# Altium schematic sheet MICRO_SD_CARD_INTERFACE.SchDoc
size A4; SheetNumber: 8; SheetTotal: 20
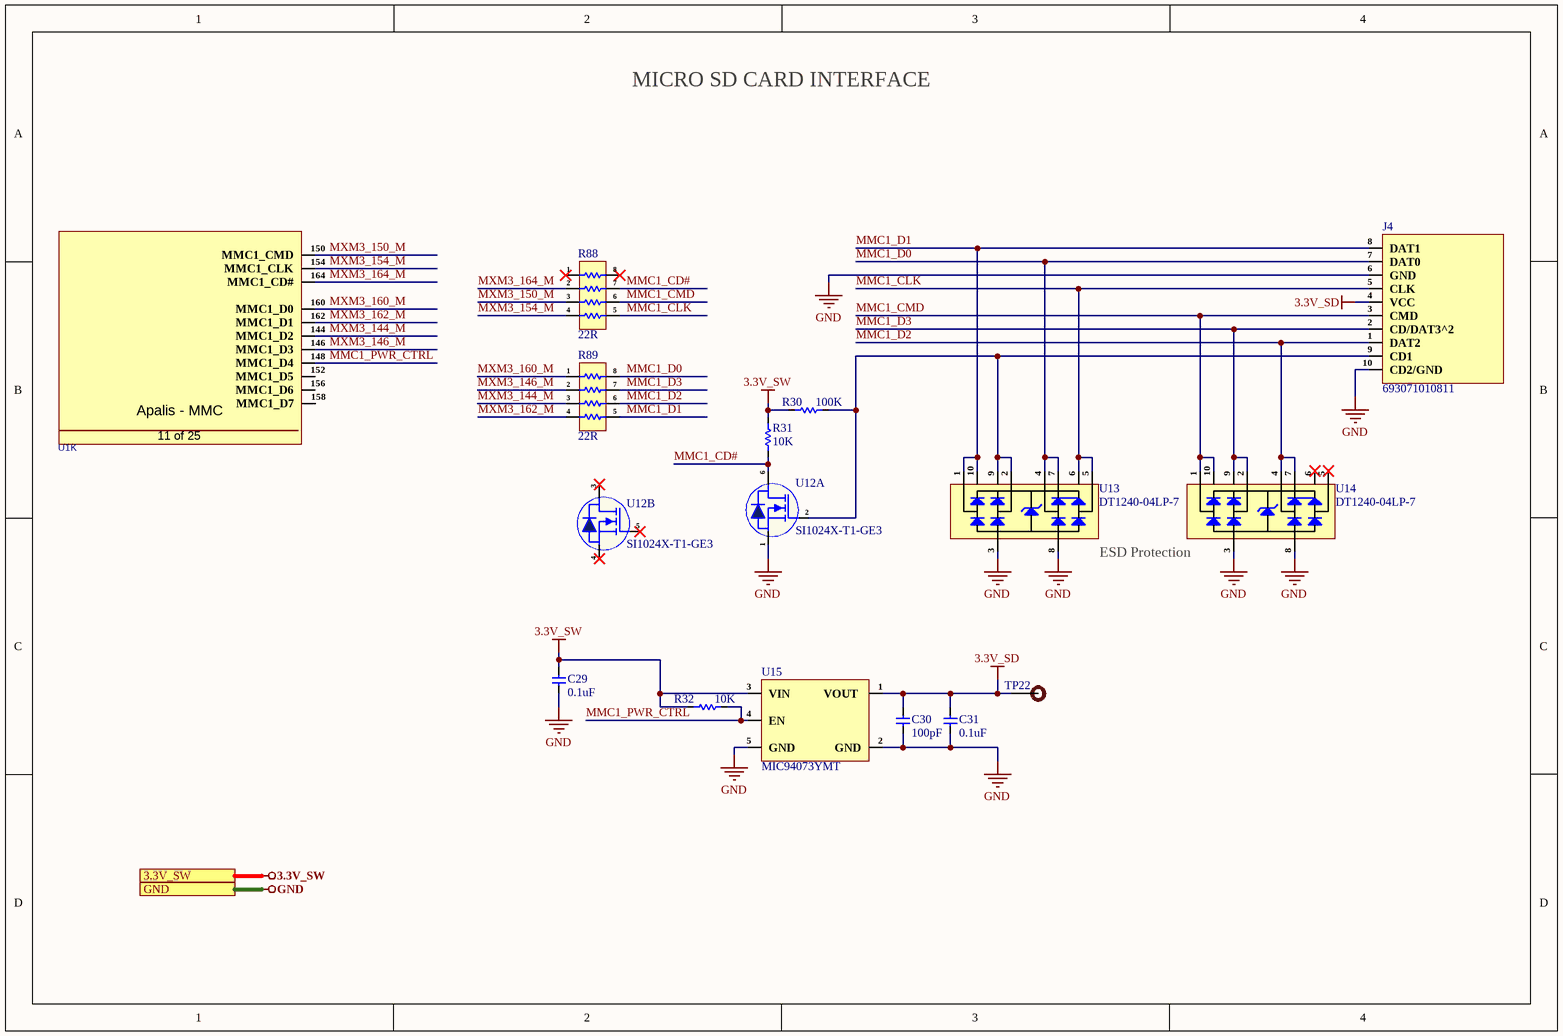
[diagram p0: MICRO_SD_CARD_INTERFACE.SchDoc]

## Parts
C29  0.1uF  [Cap-0402]
C30  100pF  [Cap-0603]
C31  0.1uF  [Cap-0402]
J4  693071010811  [693071010811]
R30  100K  [Res-0603]
R31  10K  [Res-0603]
R32  10K  [Res-0603]
R88  22R  [YC164-JR-0722RL]
R89  22R  [YC164-JR-0722RL]
TP22  DNP  [Test-point]  (value not drawn)
U1  MM70-314B1-2-R300  [MM70-314B1-2-R300]  (value not drawn)  (part K of 25)
U12  SI1024X-T1-GE3  [SC-89]  (parts A,B of 2)
U13  DT1240-04LP-7  [U-DFN2510-10]
U14  DT1240-04LP-7  [U-DFN2510-10]
U15  MIC94073YMT  [4-TMLF® (1.2x1.6)]

## Ports
3.3V_SW (see Top_Sheet[1D], DIGITAL_I-O_O-P[1D], ETHERNET_INTERFACE[1D], FUTURE_USE_CONNECTOR[1D], HDMI_INTERFACE[1D], I2C_INTERFACE[1B], UART_INTERFACE[1D]), GND (see Top_Sheet[1D], 03-CAN2_SPI_CAN_CONTROLLER[1D], APALIS_POWER_SUPPLY[1D], CAN2_SPI_CAN_CONTROLLER[1D], CODEC_INTERFACE[1D], CONNECTORS[1D], DC_DC_CONVERTER[1D], DIGITAL_I-O_O-P[1D], ETHERNET_INTERFACE[1D], FUTURE_USE_CONNECTOR[1D], GPIO_NC_INTERFACE[4B], HDMI_INTERFACE[1D], I2C_INTERFACE[1B], INPUT_SUPPLY_PROTECTION[1D], LTE_MODULE[1D], MECHANICAL_FOR_PCB[1D], Reset_and_SDIO[1D], UART_INTERFACE[1D], USB3.0_INTERFACE[1D])

## Nets
3.3V_SD: C30.2 C31.2 J4.4(VCC) TP22.1 U15.1(VOUT)
3.3V_SW: C29.2 R30.1 R31.2 R32.2 U15.3(VIN) ; port 3.3V_SW
GND: C29.1 C30.1 C31.1 J4.6(GND) J4.10(CD2/GND) U12.1(S1) U13.3 U13.8 U14.3 U14.8 U15.2(GND) U15.5(GND) ; port GND
MMC1_CD#: R31.1 R88.7 U12.6(D1)
MMC1_CLK: J4.5(CLK) R88.5 U13.5 U13.6
MMC1_CMD: J4.3(CMD) R88.6 U14.1 U14.10
MMC1_D0: J4.7(DAT0) R89.8 U13.4 U13.7
MMC1_D1: J4.8(DAT1) R89.5 U13.1 U13.10
MMC1_D2: J4.1(DAT2) R89.6 U14.4 U14.7
MMC1_D3: J4.2(CD/DAT3^2) R89.7 U14.2 U14.9
MMC1_PWR_CTRL: R32.1 U1.148(MMC1_D4) U15.4(EN)
MXM3_144_M: R89.3 U1.144(MMC1_D2)
MXM3_146_M: R89.2 U1.146(MMC1_D3)
MXM3_150_M: R88.3 U1.150(MMC1_CMD)
MXM3_154_M: R88.4 U1.154(MMC1_CLK)
MXM3_160_M: R89.1 U1.160(MMC1_D0)
MXM3_162_M: R89.4 U1.162(MMC1_D1)
MXM3_164_M: R88.2 U1.164(MMC1_CD#)
NetJ4_9: J4.9(CD1) R30.2 U12.2(G1) U13.2 U13.9

Not connected (* = marked no-connect by the designer): R88 1* 8*; U1 152(MMC1_D5) 156(MMC1_D6) 158(MMC1_D7); U12 3(D2)* 4(S2)* 5(G2)*; U14 5* 6*

## Notes on the sheet
- MICRO SD CARD INTERFACE
- ESD Protection
- (in symbol MM70-314B1-2-R300, part K) Apalis - MMC; 11 of 25

## Library data of the parts
C29 C31 = C0402C104K4REC7867: Cap Cer 0402 0.1UF 16V X7R 10%; Manufacturer: KEMET; Item Type: Capacitor; Supplier: Digi-Key; Supplier Part Number: 399-C0402C104K4REC7867CT-ND; Manufacturer Part Number: C0402C104K4REC7867; RoHS: No; Category: Ceramic Capacitors; Stock: 10918; Pricing: 1=0.1, 10=0.072, 50=0.0408, 100=0.0338, 500=0.02372, 1000=0.01963, 2500=0.01827, 5000=0.01672 (USD)
C30 = C1608NP01H101J080AA: CAP CER 100PF 50V NP0 0603; Manufacturer: TDK; Item Type: Capacitor; Supplier: Arrow Electronics; Supplier Part Number: C1608NP01H101J080AA; Manufacturer Part Number: C1608NP01H101J080AA; RoHS: Yes; Category: Ceramic Capacitors; Stock: 1236; Pricing: 1=0.1172, 10=0.0734, 25=0.0727, 50=0.0628, 100=0.0474, 250=0.0469, 500=0.0388, 1000=0.0313 (USD); ComponentLink1URL: http://www.mouser.com/ds/2/400/tdk_mlcc_commercial_general_en-542463.pdf?src-supplier=Mouser; ComponentLink1Description: http://www.mouser.com/ds/2/400/tdk_mlcc_commercial_general_en-542463.pdf?src-supplier=Mouser; ComponentLink2URL: https://datasheet.octopart.com/C1608NP01H101J080AA-TDK-datasheet-43914282.pdf?src-supplier=Future+Electronics; ComponentLink2Description: https://datasheet.octopart.com/C1608NP01H101J080AA-TDK-datasheet-43914282.pdf?src-supplier=Future+Electronics; ComponentLink3URL: https://product.tdk.com/info/en/catalog/datasheets/mlcc_commercial_hightemp_en.pdf?ref_disty=digikey&src-supplier=Digi-Key; ComponentLink3Description: https://product.tdk.com/info/en/catalog/datasheets/mlcc_commercial_hightemp_en.pdf?ref_disty=digikey&src-supplier=Digi-Key; ComponentLink4URL: https://product.tdk.com/info/en/documents/chara_sheet/C1608NP01H101J080AA.pdf?src-supplier=Digi-Key; ComponentLink4Description: https://product.tdk.com/info/en/documents/chara_sheet/C1608NP01H101J080AA.pdf?src-supplier=Digi-Key; ComponentLink5URL: http://product.tdk.com/en/catalog/datasheets/mlcc_commercial_hightemp_en.pdf?src-supplier=Avnet; ComponentLink5Description: http://product.tdk.com/en/catalog/datasheets/mlcc_commercial_hightemp_en.pdf?src-supplier=Avnet
J4 = 693071010811: CONN MICRO SD CARD PUSH-PUSH R/A; Manufacturer: Wurth Electronics; Number of Contacts: 8; Supplier: Rs; Supplier Part Number: 7636808P; Manufacturer Part Number: 693071010811; RoHS: Yes; Category: Memory Connectors; Stock: 1582; Pricing: 15=2.41, 50=2.12, 100=2.02, 250=1.74 (GBP); Mounting Technology: Surface Mount; Contact Material: Copper Alloy,Copper,Gold; Contact Plating: Gold; Min Operating Temperature: -25°C; Max Operating Temperature: 85°C; Package Quantity: 1; Packaging: Cut Tape; Series: -; Length: 14mm; Width: 15.2mm; Height: 1.98mm; RoHS Compliant: Yes; Reach SVHC Compliant: Unknown; Lead Free: Lead Free; ComponentLink1URL: https://datasheet.ciiva.com/6935/693071010811-6935152.pdf?src-supplier=Digi-Key; ComponentLink1Description: https://datasheet.ciiva.com/6935/693071010811-6935152.pdf?src-supplier=Digi-Key; ComponentLink2URL: https://datasheet.ciiva.com/25605/0900766b81113f2e-25605369.pdf?src-supplier=Rs; ComponentLink2Description: https://datasheet.ciiva.com/25605/0900766b81113f2e-25605369.pdf?src-supplier=Rs; ComponentLink3URL: https://datasheet.ciiva.com/1104/1759178-1104796.pdf?src-supplier=Element14; ComponentLink3Description: https://datasheet.ciiva.com/1104/1759178-1104796.pdf?src-supplier=Element14; ComponentLink4URL: https://datasheet.ciiva.com/6935/693071010811-6935146.pdf?src-supplier=Digi-Key; ComponentLink4Description: https://datasheet.ciiva.com/6935/693071010811-6935146.pdf?src-supplier=Digi-Key
R30 = RC0603FR-07100KL: RES 100K OHM 1% 1/10W 0603; Manufacturer: Yageo; Value: 100kR; Temperature Coefficient: 100ppm/°C; Voltage Rating (DC): 50V; Power Rating: 100mW; Supplier: Future Electronics; Supplier Part Number: 3697448; Manufacturer Part Number: RC0603FR-07100KL; RoHS: Yes; Category: Chip SMD Resistors; Stock: 11175000; Pricing: 5000=0.0013, 50000=0.0012, 75000=0.0014, 200000=0.0011, 250000=0.0014, 625000=0.0011, 750000=0.0013, 2000000=0.001, 2500000=0.0012 (USD); Case/Package: 0603; Pins: 2; Case Code (Imperial): 0603; Case Code (Metric): 1608; Min Operating Temperature: -55°C; Max Operating Temperature: 155°C; Tolerance: 1%; Resistor Type: Thick Film; Packaging: Tape and Reel; Voltage Rating: 50V; Termination: SMD/SMT; Number of Terminations: 2; Features: Moisture Resistant; Series: RC; Max Power Dissipation: 100mW; Resistance Tolerance: 1%; Construction: Rectangular; Technology: THICK FILM; Length: 1.6mm; Width: 0.8mm; Height: 0.45mm; Depth: 0.8mm; Reach SVHC Compliant: No; Lead Free: Lead Free; Military Standard: Not; RoHS Compliant: Yes
R31 R32 = RCA060310K0FKEAHP: RES SMD 10K OHM 1% 1/10W 0603; Manufacturer: Vishay Dale; Value: 10kR; Max Power Dissipation: 250mW; Temperature Coefficient: 100ppm/°C; Supplier: Future Electronics; Supplier Part Number: 4171415; Manufacturer Part Number: RCA060310K0FKEAHP; RoHS: Yes; Category: Chip SMD Resistors; Stock: 10000; Pricing: 5000=0.0413, 10000=0.0403, 15000=0.0397, 25000=0.0389, 50000=0.0374 (USD); Case/Package: 0603; Case Code (Imperial): 0603; Case Code (Metric): 1608; Min Operating Temperature: -55°C; Max Operating Temperature: 155°C; Features: Automotive AEC-Q200,Anti-Sulfur; Packaging: Cut Tape; Tolerance: 1%; Number of Terminations: 2; Series: RCA-HP; Ratings: AEC-Q200; RoHS Compliant: Yes; ComponentLink1URL: http://www.vishay.com/docs/20067/rcahp.pdf?src-supplier=Digi-Key; ComponentLink1Description: http://www.vishay.com/docs/20067/rcahp.pdf?src-supplier=Digi-Key
R88 R89 = YC164-JR-0722RL: RES ARRAY 4 RES 22 OHM 1206; Manufacturer: Yageo; Supplier: Future Electronics; Supplier Part Number: 4472155; Manufacturer Part Number: YC164-JR-0722RL; RoHS: Yes; Category: Resistor Arrays; Stock: 225000; Pricing: 5000=0.0084, 20000=0.008, 50000=0.0078, 125000=0.0075, 200000=0.0071 (USD); ComponentLink1URL: https://datasheet.ciiva.com/8018/443424-8018007.pdf?src-supplier=Element14; ComponentLink1Description: https://datasheet.ciiva.com/8018/443424-8018007.pdf?src-supplier=Element14; ComponentLink2URL: https://datasheet.ciiva.com/8018/443424-8018008.pdf?src-supplier=Element14; ComponentLink2Description: https://datasheet.ciiva.com/8018/443424-8018008.pdf?src-supplier=Element14; ComponentLink3URL: https://datasheet.ciiva.com/2688/pyu-yc-tc164-51-rohs-l-3-2688422.pdf?src-supplier=Digi-Key; ComponentLink3Description: https://datasheet.ciiva.com/2688/pyu-yc-tc164-51-rohs-l-3-2688422.pdf?src-supplier=Digi-Key; ComponentLink4URL: https://datasheet.ciiva.com/2688/pyu-yc-tc164-51-rohs-l-3-2688421.pdf?src-supplier=Digi-Key; ComponentLink4Description: https://datasheet.ciiva.com/2688/pyu-yc-tc164-51-rohs-l-3-2688421.pdf?src-supplier=Digi-Key; ComponentLink5URL: https://datasheet.ciiva.com/8320/pyu-yc-tc164-51-rohs-l-3-8320230.pdf?src-supplier=Avnet; ComponentLink5Description: https://datasheet.ciiva.com/8320/pyu-yc-tc164-51-rohs-l-3-8320230.pdf?src-supplier=Avnet; ComponentLink6URL: https://datasheet.ciiva.com/2688/pyu-yc-tc164-51-rohs-l-3-2688423.pdf?src-supplier=Digi-Key; ComponentLink6Description: https://datasheet.ciiva.com/2688/pyu-yc-tc164-51-rohs-l-3-2688423.pdf?src-supplier=Digi-Key; ComponentLink7URL: https://datasheet.ciiva.com/17030/pyu-yc-tc164-51-rohs-l-3-17030158.pdf?src-supplier=Future+Electronics; ComponentLink7Description: https://datasheet.ciiva.com/17030/pyu-yc-tc164-51-rohs-l-3-17030158.pdf?src-supplier=Future+Electronics; ComponentLink8URL: https://datasheet.ciiva.com/28379/pyu-yc-tc164-51-rohs-l-3-28379358.pdf?; ComponentLink8Description: https://datasheet.ciiva.com/28379/pyu-yc-tc164-51-rohs-l-3-28379358.pdf?
TP22 = TEST POINT: Test Point ON; Item Type: TEST POINT
U1 = MM70-314B1-2-R300: CONN MXM 3.0 FMALE 314POS 0.020; Manufacturer: JAE Electronics; Supplier: Digi-Key; Supplier Part Number: 670-MM70-314B1-2-R300CT-ND; Manufacturer Part Number: MM70-314B1-2-R300; RoHS: No; Category: Card Edge Connectors; Stock: 4979; Pricing: 1=9.21, 10=8.287, 25=7.8064, 50=7.6064, 100=7.4062 (USD)
U12 = SI1024X-T1-GE3: MOSFET 2N-CH 20V 0.485A SC89-6; Manufacturer: Vishay Siliconix; Supplier: Mouser; Supplier Part Number: 781-SI1024X-T1-GE3; Manufacturer Part Number: SI1024X-T1-GE3; RoHS: Yes; Category: MOSFETs; Stock: 297800; Pricing: 1=0.52, 10=0.442, 50=0.442, 100=0.333, 1000=0.206, 10000=0.163 (USD); ComponentLink1URL: https://datasheet.ciiva.com/1253/71170-1253313.pdf?src-supplier=Newark; ComponentLink1Description: https://datasheet.ciiva.com/1253/71170-1253313.pdf?src-supplier=Newark; ComponentLink2URL: https://datasheet.ciiva.com/6388/71170-6388105.pdf?src-supplier=Digi-Key; ComponentLink2Description: https://datasheet.ciiva.com/6388/71170-6388105.pdf?src-supplier=Digi-Key; ComponentLink3URL: https://datasheet.ciiva.com/6388/71170-6388154.pdf?src-supplier=Digi-Key; ComponentLink3Description: https://datasheet.ciiva.com/6388/71170-6388154.pdf?src-supplier=Digi-Key; ComponentLink4URL: https://datasheet.ciiva.com/6388/71170-6388155.pdf?src-supplier=Digi-Key; ComponentLink4Description: https://datasheet.ciiva.com/6388/71170-6388155.pdf?src-supplier=Digi-Key; ComponentLink5URL: https://datasheet.ciiva.com/11161/71170-11161434.pdf?src-supplier=Avnet; ComponentLink5Description: https://datasheet.ciiva.com/11161/71170-11161434.pdf?src-supplier=Avnet
U13 U14 = DT1240-04LP-7: TVS DIODE 5.5VWM 11VC U-DFN2510; Manufacturer: Diodes; Supplier: Digi-Key; Supplier Part Number: DT1240-04LP-7DICT-ND; Manufacturer Part Number: DT1240-04LP-7; RoHS: Yes; Category: TVS Diodes; Stock: 985; Pricing: 1=0.46, 10=0.319, 100=0.1612, 500=0.1315, 1000=0.09757 (USD); ComponentLink1URL: https://datasheet.ciiva.com/29574/dt1240-04lp-29574117.pdf?src-supplier=Digi-Key; ComponentLink1Description: https://datasheet.ciiva.com/29574/dt1240-04lp-29574117.pdf?src-supplier=Digi-Key; ComponentLink2URL: https://datasheet.ciiva.com/48480/dt1240-04lp-48480037.pdf?src-supplier=Avnet; ComponentLink2Description: https://datasheet.ciiva.com/48480/dt1240-04lp-48480037.pdf?src-supplier=Avnet; ComponentLink3URL: https://datasheet.ciiva.com/29574/dt1240-04lp-29574118.pdf?src-supplier=Digi-Key; ComponentLink3Description: https://datasheet.ciiva.com/29574/dt1240-04lp-29574118.pdf?src-supplier=Digi-Key; ComponentLink4URL: https://datasheet.ciiva.com/29574/dt1240-04lp-29574119.pdf?src-supplier=Digi-Key; ComponentLink4Description: https://datasheet.ciiva.com/29574/dt1240-04lp-29574119.pdf?src-supplier=Digi-Key
U15 = MIC94073YMT: HIGH SIDE POWER SWITCHES; Manufacturer: Mirel Inc.; Manufacturer Part Number: MIC94073YMT; Package: 4-UFDFN Exposed Pad, 4-TMLF®; Item Type: Power Switch